# Altium schematic sheet 16_Radar_service_USB_and_boot.SchDoc
size 289 x 396 mm
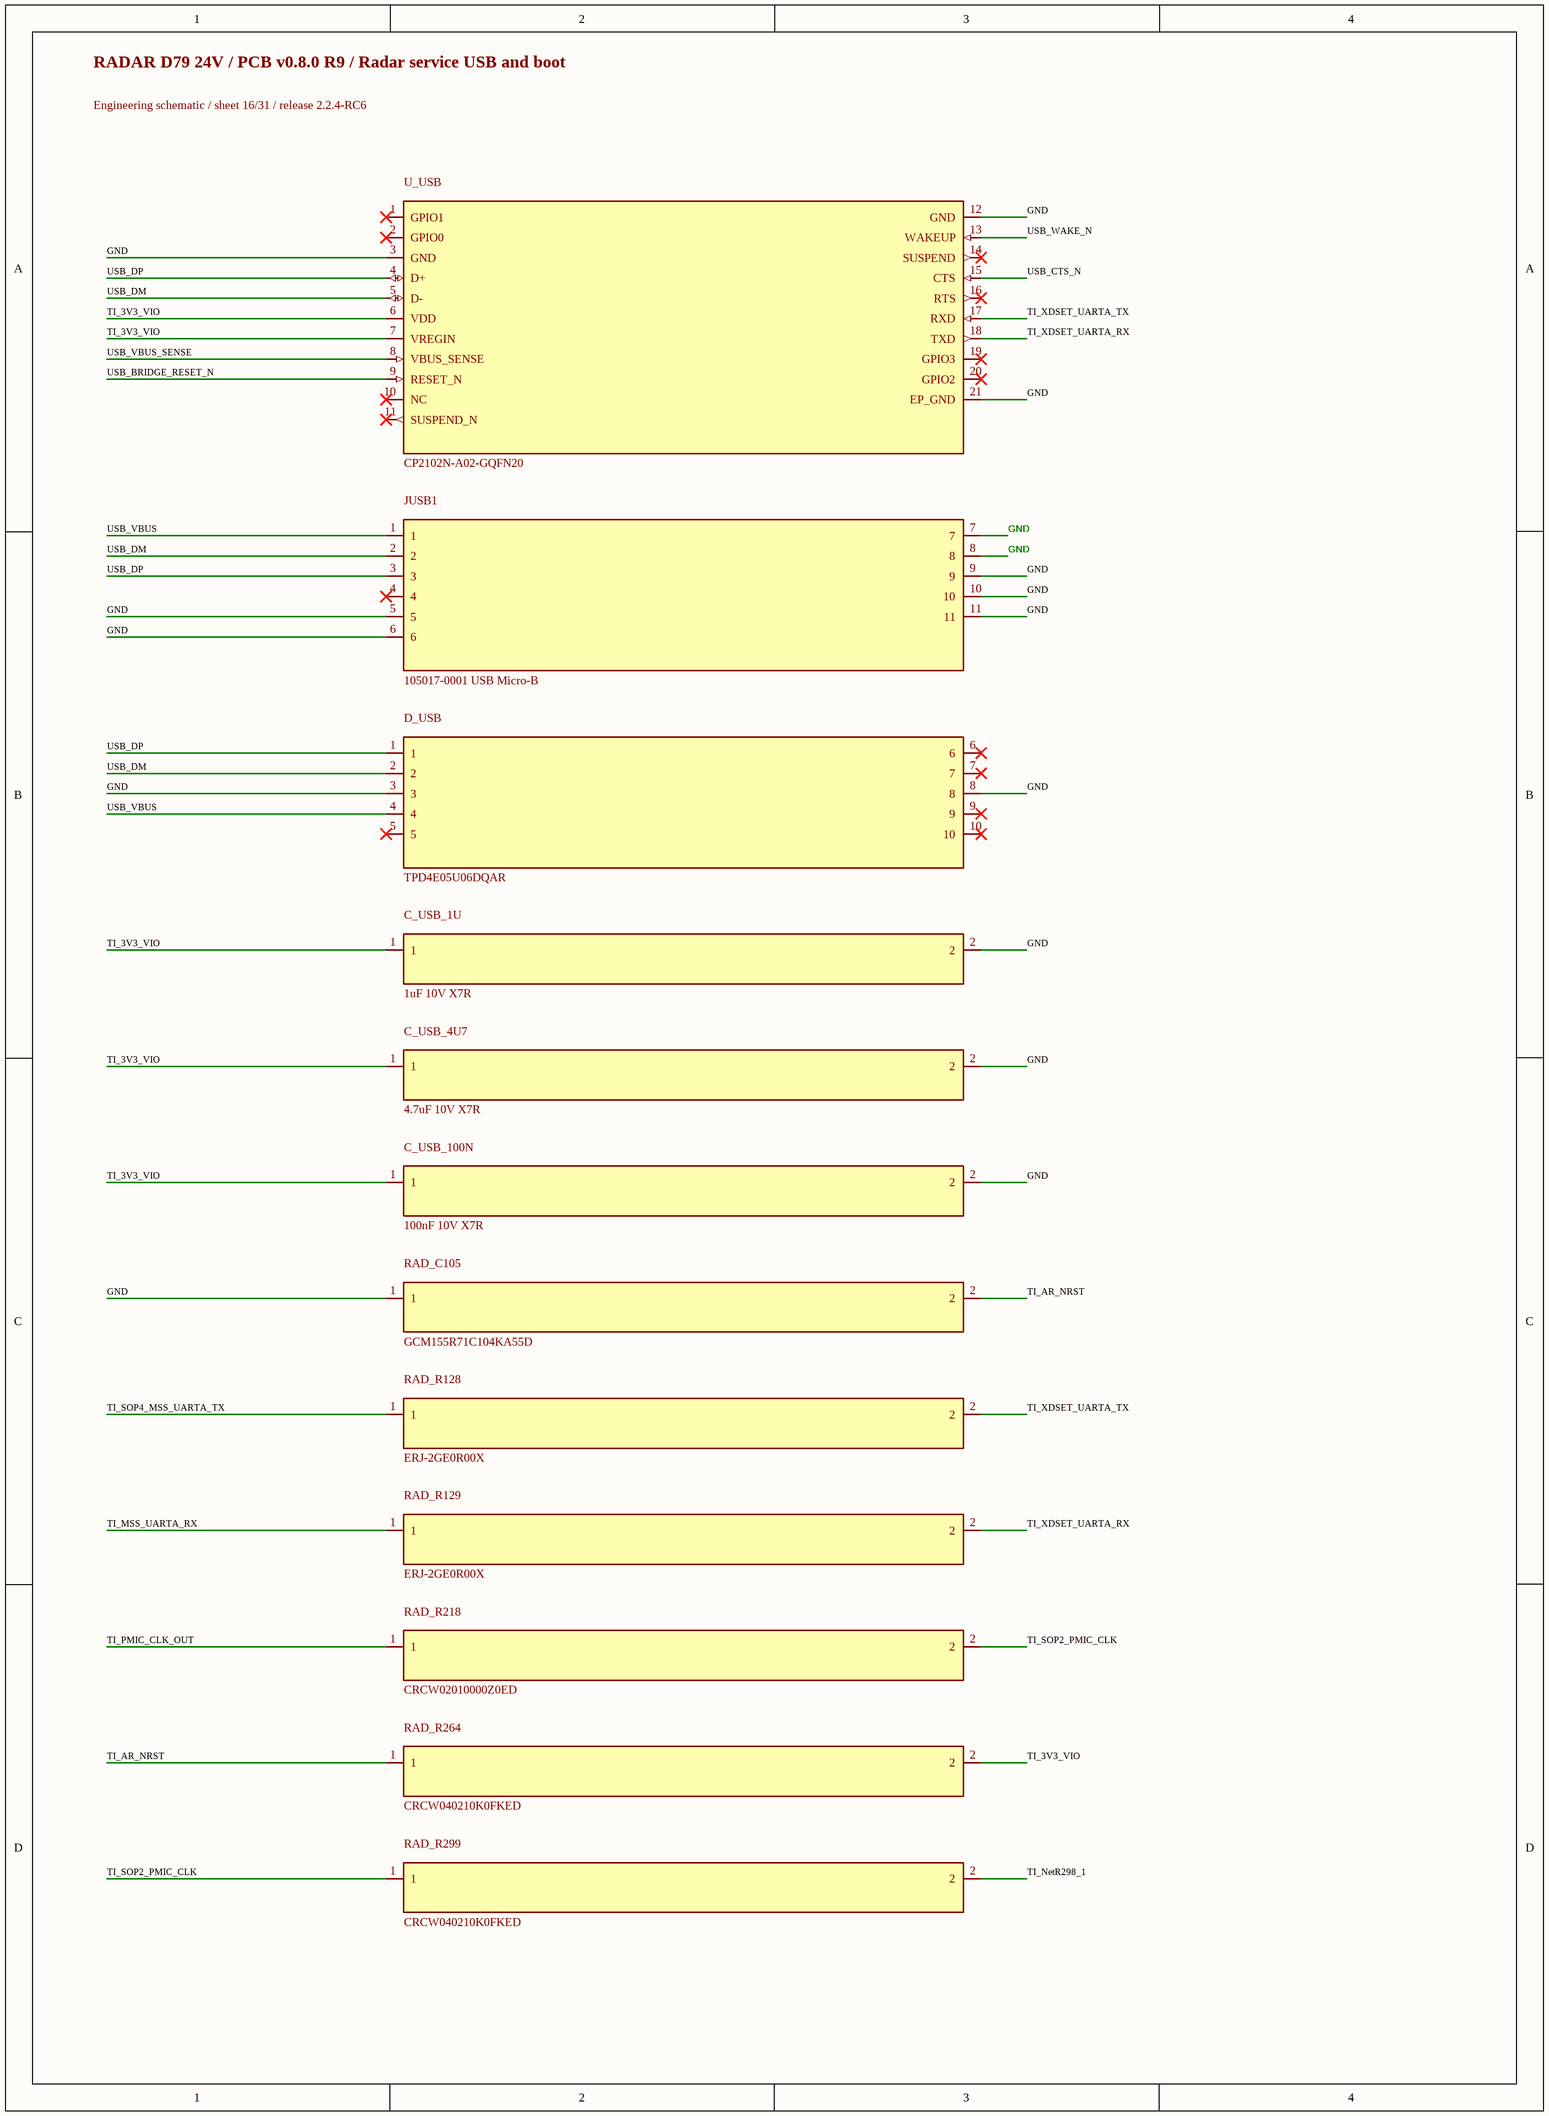
[diagram p0: 16_Radar_service_USB_and_boot.SchDoc]

## Parts
C_USB_1U  1uF 10V X7R  [C_0603_1608Metric]
C_USB_4U7  4.7uF 10V X7R  [C_0603_1608Metric]
C_USB_100N  100nF 10V X7R  [C_0402_1005Metric]
D_USB  TPD4E05U06DQAR  [USON-10_2.5x1.0mm_P0.5mm]
JUSB1  105017-0001 USB Micro-B  [CONN_105017-0001]
RAD_C105  GCM155R71C104KA55D  [0402L]
RAD_R128  ERJ-2GE0R00X  [0402L]
RAD_R129  ERJ-2GE0R00X  [0402L]
RAD_R218  CRCW02010000Z0ED  [0201L]
RAD_R264  CRCW040210K0FKED  [0402L]
RAD_R299  CRCW040210K0FKED  [0402L]
U_USB  CP2102N-A02-GQFN20  [CP2102N_QFN20_3x3_EP_Rev1p5]

## Nets
GND: C_USB_1U.2 C_USB_4U7.2 C_USB_100N.2 D_USB.3 D_USB.8 JUSB1.5 JUSB1.6 JUSB1.7 JUSB1.8 JUSB1.9 JUSB1.10 JUSB1.11 RAD_C105.1 U_USB.3(GND) U_USB.12(GND) U_USB.21(EP_GND)
TI_3V3_VIO: C_USB_1U.1 C_USB_4U7.1 C_USB_100N.1 RAD_R264.2 U_USB.6(VDD) U_USB.7(VREGIN)
TI_AR_NRST: RAD_C105.2 RAD_R264.1
TI_MSS_UARTA_RX: RAD_R129.1
TI_NetR298_1: RAD_R299.2
TI_PMIC_CLK_OUT: RAD_R218.1
TI_SOP2_PMIC_CLK: RAD_R218.2 RAD_R299.1
TI_SOP4_MSS_UARTA_TX: RAD_R128.1
TI_XDSET_UARTA_RX: RAD_R129.2 U_USB.18(TXD)
TI_XDSET_UARTA_TX: RAD_R128.2 U_USB.17(RXD)
USB_BRIDGE_RESET_N: U_USB.9(RESET_N)
USB_CTS_N: U_USB.15(CTS)
USB_DM: D_USB.2 JUSB1.2 U_USB.5(D-)
USB_DP: D_USB.1 JUSB1.3 U_USB.4(D+)
USB_VBUS: D_USB.4 JUSB1.1
USB_VBUS_SENSE: U_USB.8(VBUS_SENSE)
USB_WAKE_N: U_USB.13(WAKEUP)

Not connected (* = marked no-connect by the designer): D_USB 5* 6* 7* 9* 10*; JUSB1 4*; U_USB 1(GPIO1)* 2(GPIO0)* 10(NC)* 11(SUSPEND_N)* 14(SUSPEND)* 16(RTS)* 19(GPIO3)* 20(GPIO2)*

## Notes on the sheet
- RADAR D79 24V / PCB v0.8.0 R9 / Radar service USB and boot
- Engineering schematic / sheet 16/31 / release 2.2.4-RC6